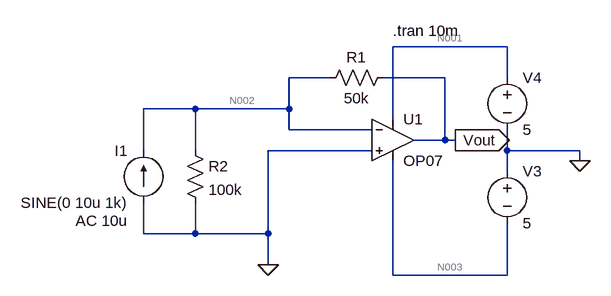
[diagram p0: schematic CL2_T10_TransimpedanceAmplifier.asc]
CL2_T10_TransimpedanceAmplifier.asc, the LTspice schematic file:
Version 4.1
SHEET 1 880 680
WIRE 400 32 224 32
WIRE 128 80 64 80
WIRE 304 80 208 80
WIRE 400 80 400 32
WIRE -80 128 -160 128
WIRE 64 128 64 80
WIRE 64 128 -80 128
WIRE 224 144 224 32
WIRE 64 160 64 128
WIRE 192 160 64 160
WIRE 304 176 304 80
WIRE 304 176 256 176
WIRE 320 176 304 176
WIRE -160 192 -160 128
WIRE -80 192 -80 128
WIRE 192 192 32 192
WIRE 400 192 400 160
WIRE 512 192 400 192
WIRE 512 208 512 192
WIRE 400 224 400 192
WIRE -160 320 -160 272
WIRE -80 320 -80 272
WIRE -80 320 -160 320
WIRE 32 320 32 192
WIRE 32 320 -80 320
WIRE 32 368 32 320
WIRE 224 384 224 208
WIRE 400 384 400 304
WIRE 400 384 224 384
FLAG 32 368 0
FLAG 512 208 0
FLAG 320 176 Vout
IOPIN 320 176 Out
SYMBOL OpAmps\\OP07 224 112 R0
SYMATTR InstName U1
SYMBOL voltage 400 64 R0
SYMATTR InstName V4
SYMATTR Value 5
SYMBOL voltage 400 208 R0
SYMATTR InstName V3
SYMATTR Value 5
SYMBOL res 224 64 R90
WINDOW 0 0 56 VBottom 2
WINDOW 3 32 56 VTop 2
SYMATTR InstName R1
SYMATTR Value 50k
SYMBOL res -96 176 R0
SYMATTR InstName R2
SYMATTR Value 100k
SYMBOL current -160 272 R180
WINDOW 0 24 80 Left 2
WINDOW 3 24 0 Left 2
WINDOW 123 24 -28 Left 2
WINDOW 39 0 0 Left 0
SYMATTR InstName I1
SYMATTR Value SINE(0 10u 1k)
SYMATTR Value2 AC 10u
TEXT 224 8 Left 2 !.tran 10m

The netlist it stands for:
* CL2_T10_TransimpedanceAmplifier.asc
X§U1 0 N002 N001 N003 Vout LT1001  ; OP07, pins In+ In- V+ V- OUT
V4 N001 0 5
V3 0 N003 5
R1 Vout N002 50k
R2 N002 0 100k
I1 0 N002 SINE(0 10u 1k) AC 10u
.tran 10m
.lib LTC.lib
.backanno
.end

* Results of the author's LTspice run, read from the files saved beside the schematic
* Operating Point, zero values left out:
*   V(n001) = 5 V
*   V(n003) = -5 V
*   I(V3) = -2.25 mA
*   I(V4) = -2.25 mA
*   Ix(u1:3) = 2.25 mA
*   Ix(u1:4) = -2.25 mA
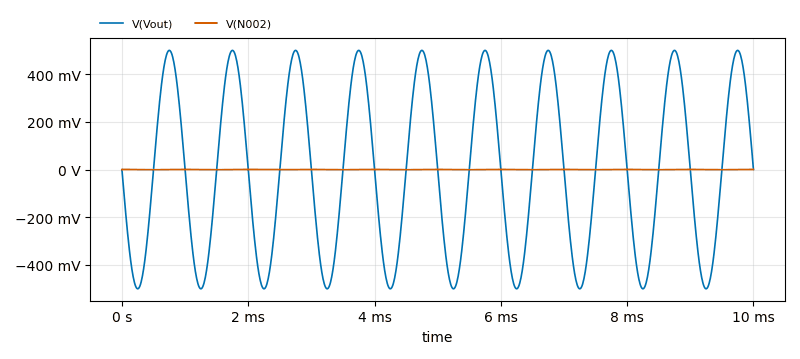
[diagram p1: Transient Analysis of CL2_T10_TransimpedanceAmplifier.asc, plotted from the saved traces]
* Transient Analysis, 1 run:
*   V(Vout): min -500 mV, max 500 mV, average 0 V, rms 353.6 mV, last 880.7 µV
*   V(N002): min -588.7 µV, max 755 µV, average -7.643 nV, rms 415.1 µV, last 586.9 µV